# Altium schematic sheet 04_MEMORY.SchDoc: Схема электрическая принципиальная
size 420 x 297 mm; ApprovedBy: Скрябин; CheckedBy: Скрябин; Author: Корсунов; CompanyName: РТУ МИРЭА; SheetNumber: 4; SheetTotal: 11; PageSetup: Record=PageOptions|CenterHorizontal=True|CenterVertical=True|PrintScale=0.94|XCorrection=1.00|YCorrection=1.00|PrintKind=1|BorderSize=5000000|LeftOffset=0|BottomOffset=0|Orientation=1|PaperLength=1000|PaperWidth=1000|Scale=100|PaperSource=7|PrintQuality=-4|MediaType=1|DitherType=10|PaperKind=A4|PrintScaleMode=1; DecimalNumber: RP23.000001.004 Э3; Name1: Модуль ввода-вывода; lit_A: О; Name2: RP2350 OPC UA
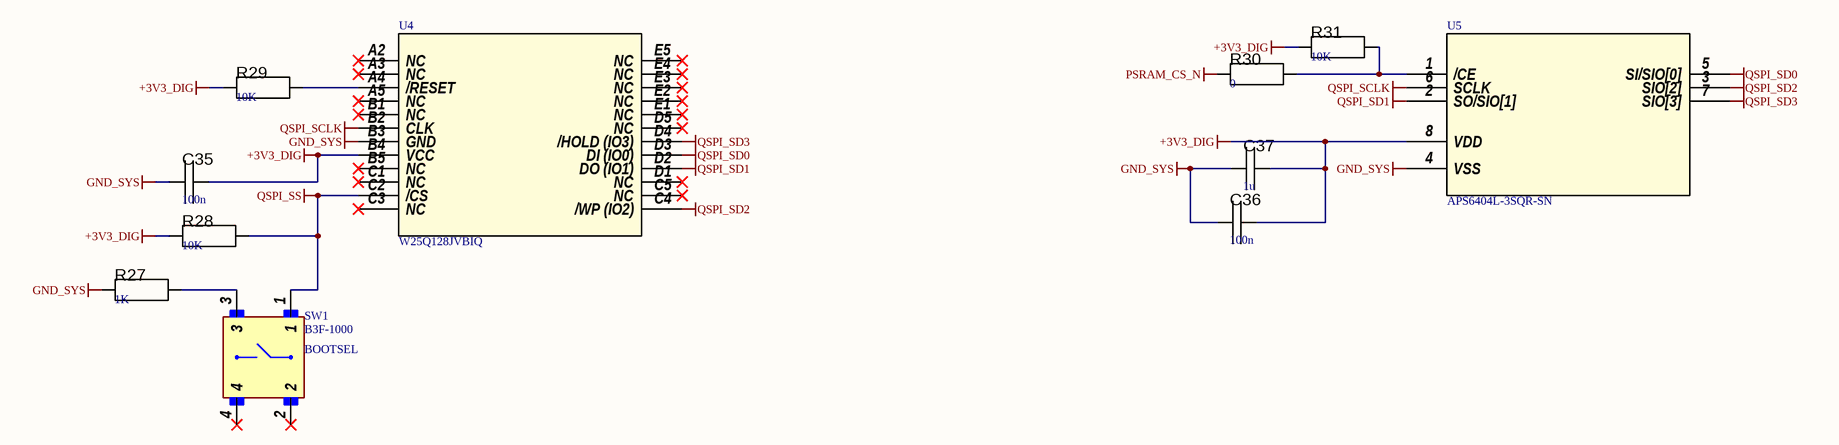
[diagram p0: 04_MEMORY.SchDoc]

## Parts
C35  value 100n  [C_0603]  (hidden comment: Capacitor)
C36  value 100n  [C_0603]  (hidden comment: Capacitor)
C37  value 1u  [C_0603]  (hidden comment: Capacitor)
R27  value 1K  [R_0603]  (hidden comment: Resistor)
R28  value 10K  [R_0603]  (hidden comment: Resistor)
R29  value 10K  [R_0603]  (hidden comment: Resistor)
R30  value 0  [R_0603]  (hidden comment: Resistor)
R31  value 10K  [R_0603]  (hidden comment: Resistor)
SW1  B3F-1000  [SW_B3F-1000]
U4  W25Q128JVBIQ  [TFBGA_128JVBIQ_WIN]
U5  APS6404L-3SQR-SN  [APS6404L-3SQR-SN_APY]

## Nets
+3V3_DIG: C35.2 C36.2 C37.2 R28.1 R29.1 R31.1 U4.B4(VCC) U5.8(VDD)
GND_SYS: C35.1 C36.1 C37.1 R27.1 U4.B3(GND) U5.4(VSS)
PSRAM_CS_N: R30.1
QSPI_SCLK: U4.B2(CLK) U5.6(SCLK)
QSPI_SD0: U4.D3(DI_(IO0)) U5.5(SI/SIO[0])
QSPI_SD1: U4.D2(DO_(IO1)) U5.2(SO/SIO[1])
QSPI_SD2: U4.C4(/WP_(IO2)) U5.3(SIO[2])
QSPI_SD3: U4.D4(/HOLD_(IO3)) U5.7(SIO[3])
QSPI_SS: R28.2 SW1.1 U4.C2(/CS)
NetR27_2: R27.2 SW1.3
NetR29_2: R29.2 U4.A4(/RESET)
NetR30_2: R30.2 R31.2 U5.1(/CE)

Not connected (* = marked no-connect by the designer): SW1 2* 4*; U4 A2(NC)* A3(NC)* A5(NC)* B1(NC)* B5(NC)* C1(NC)* C3(NC)* C5(NC)* D1(NC)* D5(NC)* E1(NC)* E2(NC)* E3(NC)* E4(NC)* E5(NC)*

## Notes on the sheet
- (near SW1) BOOTSEL
- Перв.примен.
- Справ.№
- Подп. и дата
- Инв.№ дубл.
- Взам.инв.№
- Подп.и дата
- Разраб.
- Изм.
- Лист
- № докум.
- Подп.
- Дата
- Лит.
- Масштаб
- Масса
- Т.контр.
- Пров.
- СХЕМА   ЭЛЕКТРИЧЕСКАЯ
- ПРИНЦИПИАЛЬНАЯ
- Листов
- Инв.№ подл.
- Утв.
- Н.контр.
- Нач.сект.
- Формат  A3

## Library data of the parts
C35-C37 = Capacitor: SimulationGenericComponent: True
R27-R29 R31 = Resistor: TC1: 0; SimulationGenericComponent: True; TC2: 0
R30 = Resistor: SimulationGenericComponent: True; TC1: 0; TC2: 0
SW1 = B3F-1000: Tactile Switch SPST-NO Top Actuated Through Hole; MF: Omron; Price: None; Check_prices: https://www.snapeda.com/parts/B3F-1000/Omron+Electronics+Inc-EMC+Div/view-part/?ref=eda; Purchase-URL: https://pricing.snapeda.com/search/part/B3F-1000/?ref=eda; Value: *; Package: None; Availability: In Stock; MP: B3F-1000; SnapEDA_Link: https://www.snapeda.com/parts/B3F-1000/Omron+Electronics+Inc-EMC+Div/view-part/?ref=snap
U4 = W25Q128JVBIQ: No Description Available; Manufacturer_Name: Winbond; Type: Memory; Copyright: Copyright (C) 2026 Ultra Librarian. All rights reserved.; Manufacturer_Part_Number: W25Q128JVBIQ; RefDes: RefDes
U5 = APS6404L-3SQR-SN: Description; Manufacturer_Name: AP Memory; Copyright: Copyright (C) 2025 Ultra Librarian. All rights reserved.; Manufacturer_Part_Number: APS6404L-3SQR-SN; RefDes: RefDes; Type: Type